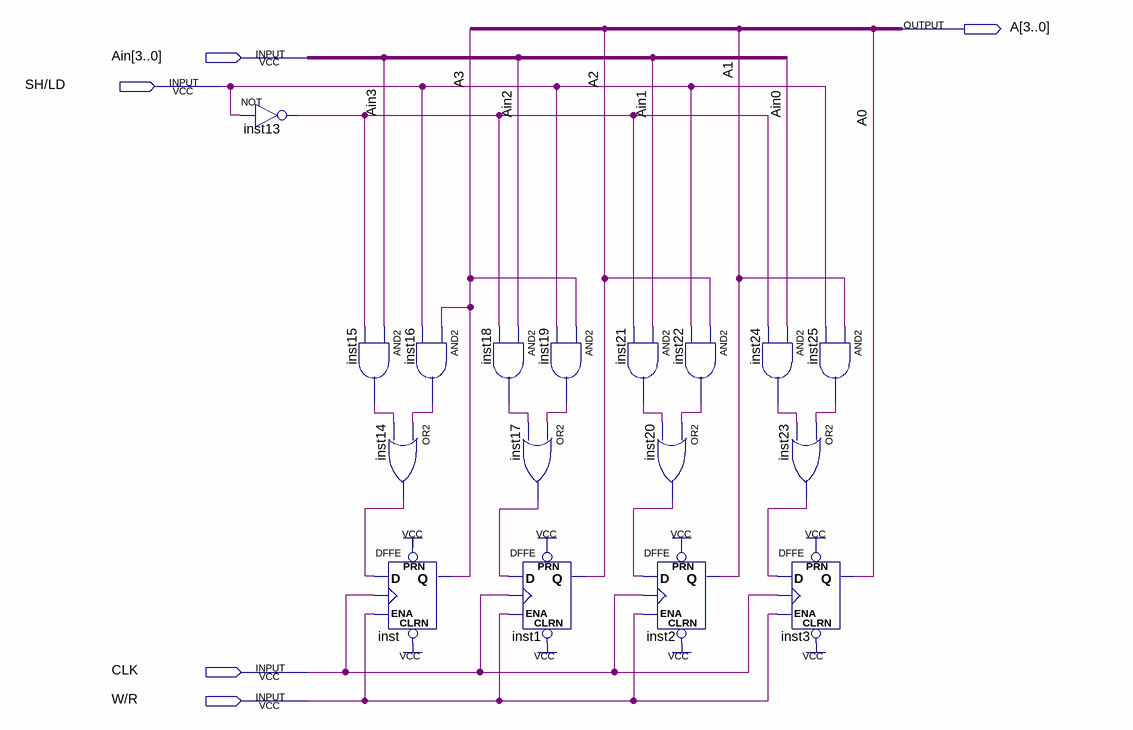
[diagram p0: schematic sheet]
// Quartus schematic registro-A.bdf as structural Verilog: 17 symbols, 5 pins
module \registro-A  (
  input  [3:0] Ain,
  input  \SH/LD ,
  input  CLK,
  input  \W/R ,
  output [3:0] A
);

  wire inst13_out, inst14_out, inst15_out, inst16_out, inst17_out, inst18_out, inst19_out, inst20_out,
       inst21_out, inst22_out, inst23_out, inst24_out, inst25_out;

  not inst13 (inst13_out, \SH/LD );
  and inst15 (inst15_out, Ain[3], inst13_out);
  and inst16 (inst16_out, A[3], \SH/LD );
  or inst14 (inst14_out, inst16_out, inst15_out);
  DFFE inst (.PRN(1'b1), .CLRN(1'b1), .D(inst14_out), .CLK(CLK), .ENA(\W/R ), .Q(A[3]));
  and inst18 (inst18_out, Ain[2], inst13_out);
  and inst19 (inst19_out, A[3], \SH/LD );
  or inst17 (inst17_out, inst19_out, inst18_out);
  DFFE inst1 (.PRN(1'b1), .CLRN(1'b1), .D(inst17_out), .CLK(CLK), .ENA(\W/R ), .Q(A[2]));
  and inst21 (inst21_out, Ain[1], inst13_out);
  or inst20 (inst20_out, inst22_out, inst21_out);
  DFFE inst2 (.PRN(1'b1), .CLRN(1'b1), .D(inst20_out), .CLK(CLK), .ENA(\W/R ), .Q(A[1]));
  and inst22 (inst22_out, A[2], \SH/LD );
  and inst24 (inst24_out, Ain[0], inst13_out);
  or inst23 (inst23_out, inst25_out, inst24_out);
  DFFE inst3 (.PRN(1'b1), .CLRN(1'b1), .D(inst23_out), .CLK(CLK), .ENA(\W/R ), .Q(A[0]));
  and inst25 (inst25_out, A[1], \SH/LD );
endmodule
